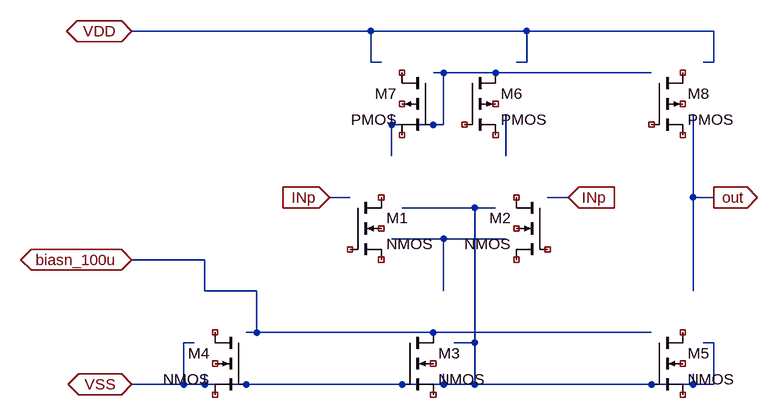
[diagram p0: schematic TESTING.asc]
TESTING.asc, the LTspice schematic file:
Version 4
SHEET 1 880 680
WIRE 160 32 -208 32
WIRE 192 32 160 32
WIRE 368 32 192 32
WIRE 400 32 368 32
WIRE 656 32 400 32
WIRE 688 32 656 32
WIRE 160 80 160 32
WIRE 176 80 160 80
WIRE 400 80 400 32
WIRE 400 80 384 80
WIRE 688 80 688 32
WIRE 688 80 672 80
WIRE 272 96 256 96
WIRE 304 96 272 96
WIRE 592 96 304 96
WIRE 192 176 192 160
WIRE 272 176 272 96
WIRE 272 176 192 176
WIRE 192 224 192 176
WIRE 368 224 368 160
WIRE 128 288 96 288
WIRE 464 288 432 288
WIRE 656 288 656 160
WIRE 688 288 656 288
WIRE 320 304 208 304
WIRE 352 304 320 304
WIRE 272 352 192 352
WIRE 368 352 272 352
WIRE -96 384 -208 384
WIRE -96 432 -96 384
WIRE -16 432 -96 432
WIRE 272 432 272 352
WIRE 656 432 656 288
WIRE -16 496 -16 432
WIRE -16 496 -32 496
WIRE 208 496 -16 496
WIRE 592 496 208 496
WIRE -112 512 -128 512
WIRE 320 512 320 304
WIRE 320 512 288 512
WIRE 688 512 672 512
WIRE -128 576 -128 512
WIRE -128 576 -208 576
WIRE -96 576 -96 560
WIRE -96 576 -128 576
WIRE 272 576 272 560
WIRE 272 576 -96 576
WIRE 320 576 320 512
WIRE 320 576 272 576
WIRE 656 576 656 560
WIRE 656 576 320 576
WIRE 688 576 688 512
WIRE 688 576 656 576
FLAG -208 32 VDD
IOPIN -208 32 BiDir
FLAG -208 576 VSS
IOPIN -208 576 BiDir
FLAG -208 384 biasn_100u
IOPIN -208 384 BiDir
FLAG 464 288 INp
IOPIN 464 288 In
FLAG 96 288 INp
IOPIN 96 288 In
FLAG 688 288 out
IOPIN 688 288 Out
SYMBOL nmos4 128 288 R0
SYMATTR InstName M1
SYMBOL nmos4 432 288 M0
SYMATTR InstName M2
SYMBOL nmos4 208 496 R0
SYMATTR InstName M3
SYMBOL nmos4 -32 496 M0
SYMATTR InstName M4
SYMBOL nmos4 592 496 R0
SYMATTR InstName M5
SYMBOL pmos4 304 96 R0
SYMATTR InstName M6
SYMBOL pmos4 256 96 M0
SYMATTR InstName M7
SYMBOL pmos4 592 96 R0
SYMATTR InstName M8

The netlist it stands for:
* TESTING.asc
* M1: NMOS (symbol nmos4 not certain, pin order unknown); nets seen at it: 
* M2: NMOS (symbol nmos4 not certain, pin order unknown); nets seen at it: 
M3 biasn_100u VSS NC_09 NC_10 NMOS
* M4: NMOS (symbol nmos4 not certain, pin order unknown); nets seen at it: VSS
* M5: NMOS (symbol nmos4 not certain, pin order unknown); nets seen at it: VSS
M6 N001 NC_17 NC_18 NC_19 PMOS
* M7: PMOS (symbol pmos4 not certain, pin order unknown); nets seen at it: N001
* M8: PMOS (symbol pmos4 not certain, pin order unknown); nets seen at it: 
.model NMOS NMOS
.model PMOS PMOS
.lib standard.mos
.backanno
.end